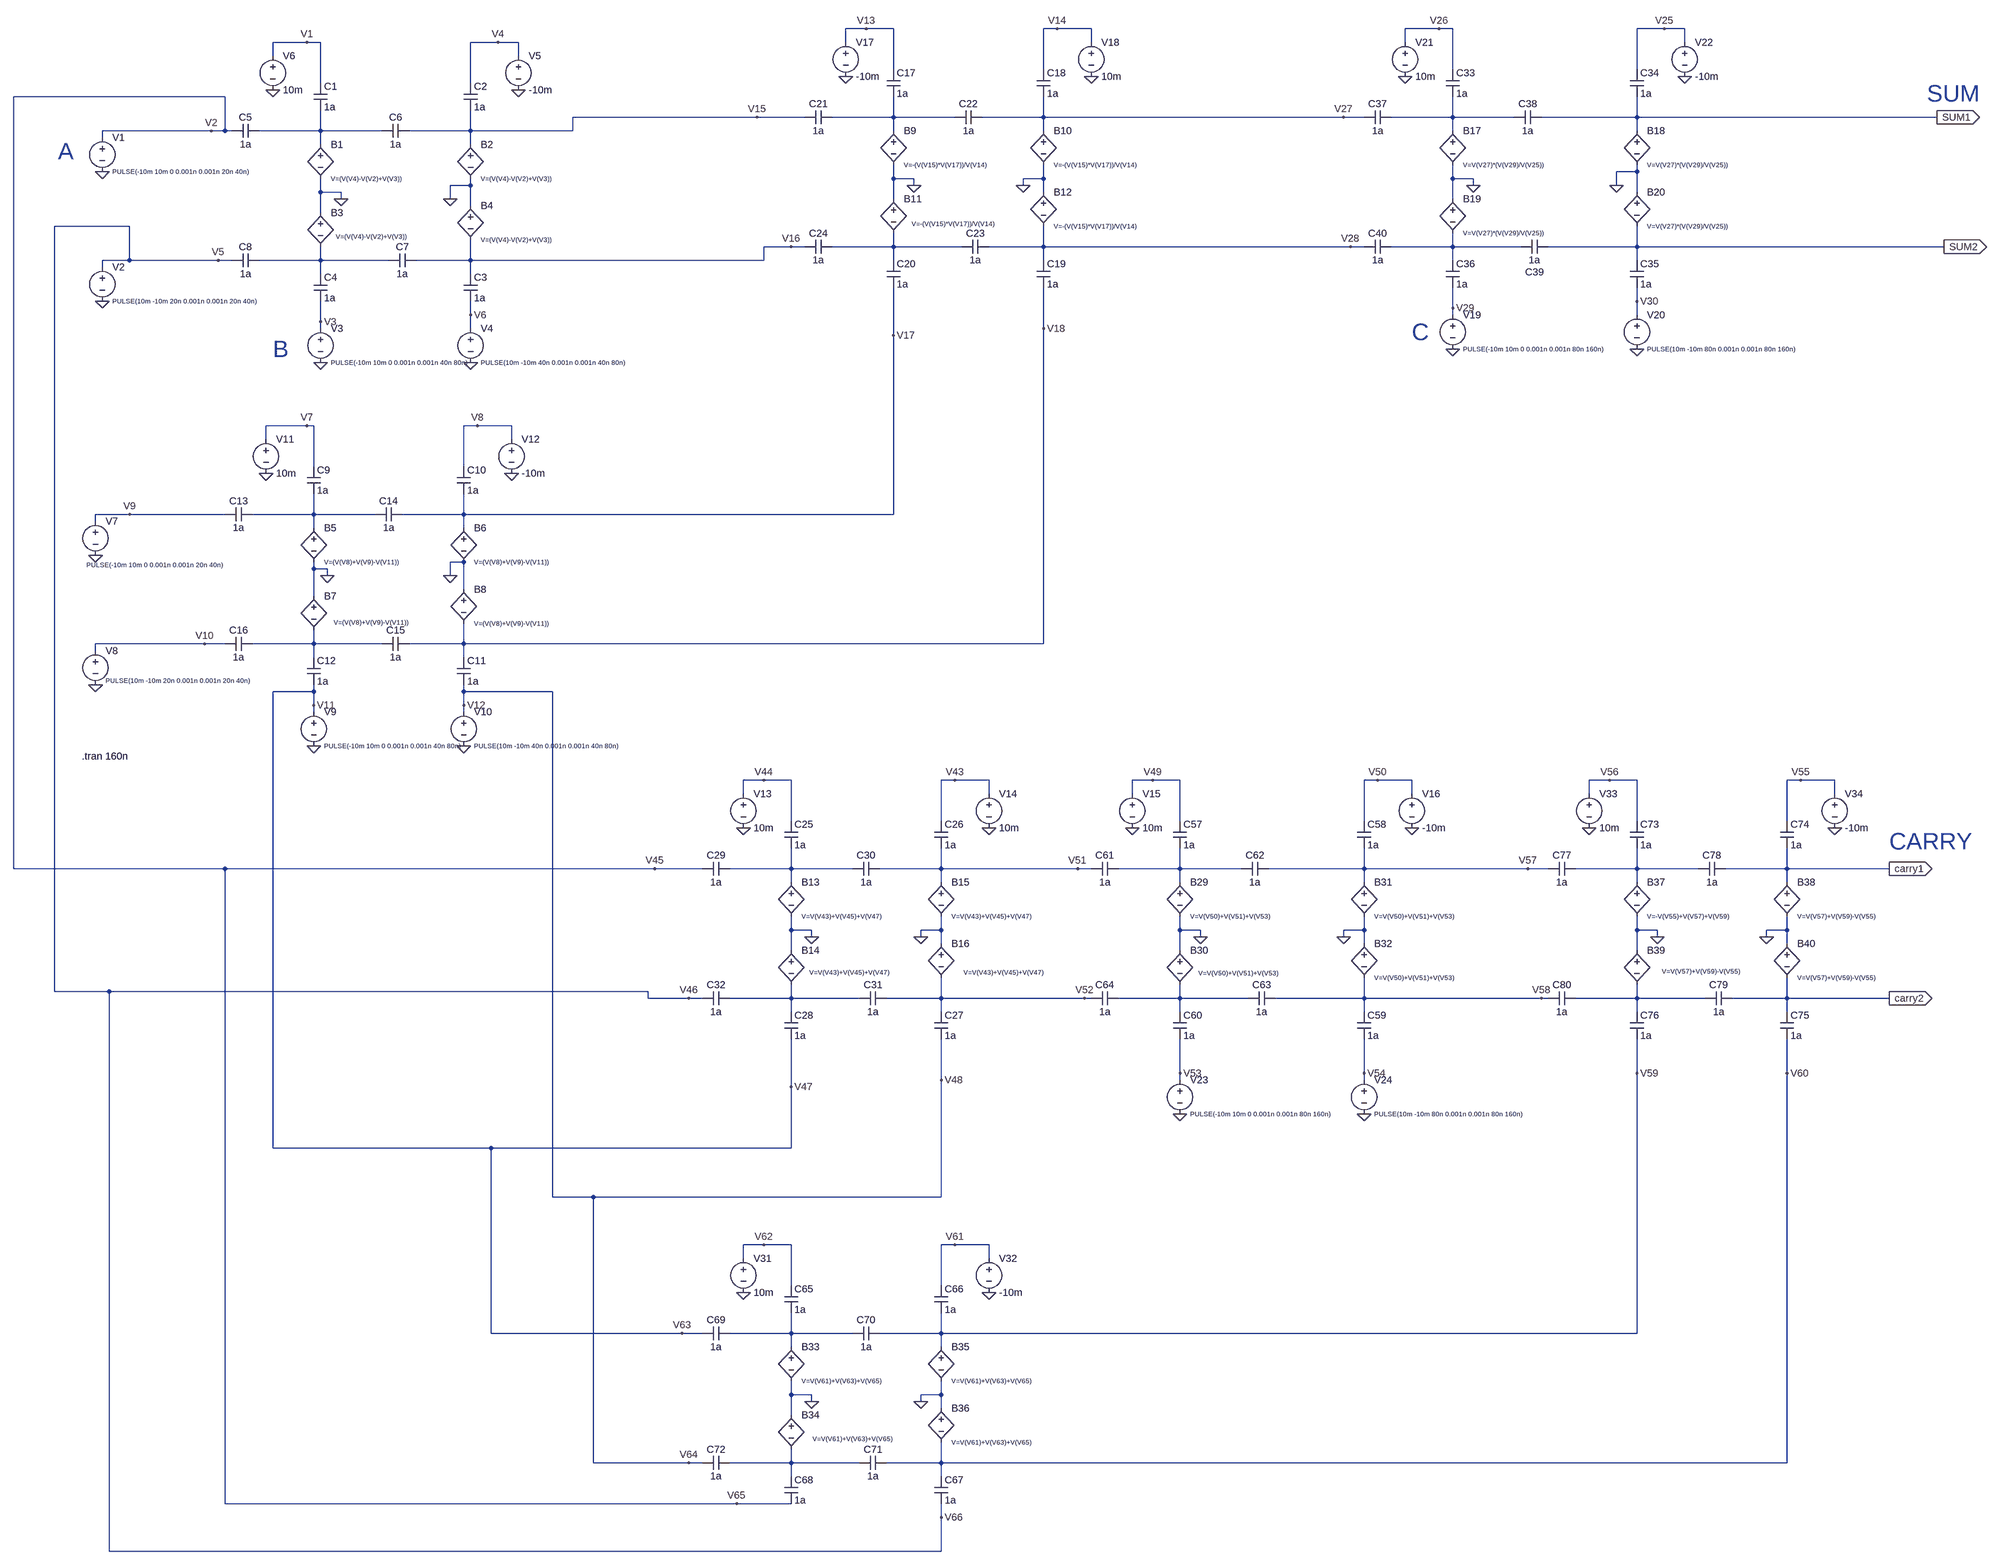
[diagram p0: schematic full_adder.asc]
full_adder.asc, the LTspice schematic file:
Version 4.1
SHEET 1 4352 3636
WIRE 912 -400 864 -400
WIRE 976 -400 912 -400
WIRE 1360 -400 1328 -400
WIRE 1440 -400 1360 -400
WIRE 2256 -400 2176 -400
WIRE 2288 -400 2256 -400
WIRE 2784 -400 2720 -400
WIRE 2832 -400 2784 -400
WIRE -400 -368 -480 -368
WIRE -368 -368 -400 -368
WIRE 48 -368 -16 -368
WIRE 96 -368 48 -368
WIRE 864 -368 864 -400
WIRE 1440 -368 1440 -400
WIRE 2176 -368 2176 -400
WIRE 2832 -368 2832 -400
WIRE -480 -336 -480 -368
WIRE 96 -336 96 -368
WIRE 976 -304 976 -400
WIRE 1328 -304 1328 -400
WIRE 2288 -304 2288 -400
WIRE 2720 -304 2720 -400
WIRE -368 -272 -368 -368
WIRE -16 -272 -16 -368
WIRE -592 -240 -1088 -240
WIRE 656 -192 224 -192
WIRE 768 -192 656 -192
WIRE 976 -192 976 -240
WIRE 976 -192 832 -192
WIRE 1120 -192 976 -192
WIRE 1328 -192 1328 -240
WIRE 1328 -192 1184 -192
WIRE 2032 -192 1328 -192
WIRE 2080 -192 2032 -192
WIRE 2288 -192 2288 -240
WIRE 2288 -192 2144 -192
WIRE 2432 -192 2288 -192
WIRE 2720 -192 2720 -240
WIRE 2720 -192 2496 -192
WIRE 3424 -192 2720 -192
WIRE -624 -160 -880 -160
WIRE -592 -160 -592 -240
WIRE -592 -160 -624 -160
WIRE -576 -160 -592 -160
WIRE -368 -160 -368 -208
WIRE -368 -160 -512 -160
WIRE -224 -160 -368 -160
WIRE -16 -160 -16 -208
WIRE -16 -160 -160 -160
WIRE 224 -160 224 -192
WIRE 224 -160 -16 -160
WIRE 976 -160 976 -192
WIRE 1328 -160 1328 -192
WIRE 2288 -160 2288 -192
WIRE 2720 -160 2720 -192
WIRE -880 -144 -880 -160
WIRE -368 -128 -368 -160
WIRE -16 -128 -16 -160
WIRE 2720 -64 2720 -80
WIRE 2720 -64 2672 -64
WIRE 976 -48 976 -80
WIRE 1024 -48 976 -48
WIRE 1328 -48 1328 -80
WIRE 1328 -48 1280 -48
WIRE 2288 -48 2288 -80
WIRE 2336 -48 2288 -48
WIRE -16 -32 -16 -48
WIRE -16 -32 -64 -32
WIRE 1024 -32 1024 -48
WIRE 1280 -32 1280 -48
WIRE 2336 -32 2336 -48
WIRE 2672 -32 2672 -64
WIRE -368 -16 -368 -48
WIRE -320 -16 -368 -16
WIRE 1328 -16 1328 -48
WIRE 2720 -16 2720 -64
WIRE -320 0 -320 -16
WIRE -64 0 -64 -32
WIRE 976 0 976 -48
WIRE 2288 0 2288 -48
WIRE -16 16 -16 -32
WIRE -368 32 -368 -16
WIRE -816 64 -992 64
WIRE 736 112 672 112
WIRE 768 112 736 112
WIRE 976 112 976 80
WIRE 976 112 832 112
WIRE 1136 112 976 112
WIRE 1328 112 1328 64
WIRE 1328 112 1200 112
WIRE 2048 112 1328 112
WIRE 2080 112 2048 112
WIRE 2288 112 2288 80
WIRE 2288 112 2144 112
WIRE 2448 112 2288 112
WIRE 2720 112 2720 64
WIRE 2720 112 2512 112
WIRE 3440 112 2720 112
WIRE -816 144 -816 64
WIRE -816 144 -880 144
WIRE -608 144 -816 144
WIRE -576 144 -608 144
WIRE -368 144 -368 112
WIRE -368 144 -512 144
WIRE -208 144 -368 144
WIRE -16 144 -16 96
WIRE -16 144 -144 144
WIRE 672 144 672 112
WIRE 672 144 -16 144
WIRE 976 144 976 112
WIRE 1328 144 1328 112
WIRE 2288 144 2288 112
WIRE 2720 144 2720 112
WIRE -880 160 -880 144
WIRE -368 176 -368 144
WIRE -16 176 -16 144
WIRE 2720 240 2720 208
WIRE 2288 256 2288 208
WIRE -16 272 -16 240
WIRE 2288 272 2288 256
WIRE 2720 272 2720 240
WIRE -368 288 -368 240
WIRE -368 304 -368 288
WIRE -16 304 -16 272
WIRE 1328 304 1328 208
WIRE 976 320 976 208
WIRE -400 544 -496 544
WIRE -384 544 -400 544
WIRE 0 544 -32 544
WIRE 80 544 0 544
WIRE -496 576 -496 544
WIRE 80 576 80 544
WIRE -384 640 -384 544
WIRE -32 640 -32 544
WIRE -816 752 -896 752
WIRE -592 752 -816 752
WIRE -384 752 -384 704
WIRE -384 752 -528 752
WIRE -240 752 -384 752
WIRE -32 752 -32 704
WIRE -32 752 -176 752
WIRE 976 752 976 320
WIRE 976 752 -32 752
WIRE -896 768 -896 752
WIRE -384 784 -384 752
WIRE -32 784 -32 752
WIRE -32 864 -64 864
WIRE -384 880 -384 864
WIRE -352 880 -384 880
WIRE -352 896 -352 880
WIRE -64 896 -64 864
WIRE -32 928 -32 864
WIRE -384 944 -384 880
WIRE -640 1056 -896 1056
WIRE -592 1056 -640 1056
WIRE -384 1056 -384 1024
WIRE -384 1056 -528 1056
WIRE -224 1056 -384 1056
WIRE -32 1056 -32 1008
WIRE -32 1056 -160 1056
WIRE 1328 1056 1328 304
WIRE 1328 1056 -32 1056
WIRE -896 1072 -896 1056
WIRE -384 1088 -384 1056
WIRE -32 1088 -32 1056
WIRE -384 1168 -384 1152
WIRE -384 1168 -480 1168
WIRE -32 1168 -32 1152
WIRE 176 1168 -32 1168
WIRE -384 1200 -384 1168
WIRE -32 1200 -32 1168
WIRE -384 1216 -384 1200
WIRE -32 1216 -32 1200
WIRE 672 1376 624 1376
WIRE 736 1376 672 1376
WIRE 1120 1376 1088 1376
WIRE 1200 1376 1120 1376
WIRE 1584 1376 1536 1376
WIRE 1648 1376 1584 1376
WIRE 2112 1376 2080 1376
WIRE 2192 1376 2112 1376
WIRE 2656 1376 2608 1376
WIRE 2720 1376 2656 1376
WIRE 3104 1376 3072 1376
WIRE 3184 1376 3104 1376
WIRE 624 1408 624 1376
WIRE 1200 1408 1200 1376
WIRE 1536 1408 1536 1376
WIRE 2192 1408 2192 1376
WIRE 2608 1408 2608 1376
WIRE 3184 1408 3184 1376
WIRE 736 1472 736 1376
WIRE 1088 1472 1088 1376
WIRE 1648 1472 1648 1376
WIRE 2080 1472 2080 1376
WIRE 2720 1472 2720 1376
WIRE 3072 1472 3072 1376
WIRE -1088 1584 -1088 -240
WIRE -592 1584 -1088 1584
WIRE 416 1584 -592 1584
WIRE 528 1584 416 1584
WIRE 736 1584 736 1536
WIRE 736 1584 592 1584
WIRE 880 1584 736 1584
WIRE 1088 1584 1088 1536
WIRE 1088 1584 944 1584
WIRE 1408 1584 1088 1584
WIRE 1440 1584 1408 1584
WIRE 1648 1584 1648 1536
WIRE 1648 1584 1504 1584
WIRE 1792 1584 1648 1584
WIRE 2080 1584 2080 1536
WIRE 2080 1584 1856 1584
WIRE 2464 1584 2080 1584
WIRE 2512 1584 2464 1584
WIRE 2720 1584 2720 1536
WIRE 2720 1584 2576 1584
WIRE 2864 1584 2720 1584
WIRE 3072 1584 3072 1536
WIRE 3072 1584 2928 1584
WIRE 3312 1584 3072 1584
WIRE 736 1616 736 1584
WIRE 1088 1616 1088 1584
WIRE 1648 1616 1648 1584
WIRE 2080 1616 2080 1584
WIRE 2720 1616 2720 1584
WIRE 3072 1616 3072 1584
WIRE 736 1728 736 1696
WIRE 784 1728 736 1728
WIRE 1088 1728 1088 1696
WIRE 1088 1728 1040 1728
WIRE 1648 1728 1648 1696
WIRE 1696 1728 1648 1728
WIRE 2080 1728 2080 1696
WIRE 2080 1728 2032 1728
WIRE 2720 1728 2720 1696
WIRE 2768 1728 2720 1728
WIRE 3072 1728 3072 1696
WIRE 3072 1728 3024 1728
WIRE 784 1744 784 1728
WIRE 1040 1744 1040 1728
WIRE 1696 1744 1696 1728
WIRE 2032 1744 2032 1728
WIRE 2768 1744 2768 1728
WIRE 3024 1744 3024 1728
WIRE 1088 1760 1088 1728
WIRE 2080 1760 2080 1728
WIRE 3072 1760 3072 1728
WIRE 736 1776 736 1728
WIRE 1648 1776 1648 1728
WIRE 2720 1776 2720 1728
WIRE -992 1872 -992 64
WIRE -864 1872 -992 1872
WIRE 400 1872 -864 1872
WIRE 400 1888 400 1872
WIRE 496 1888 400 1888
WIRE 528 1888 496 1888
WIRE 736 1888 736 1856
WIRE 736 1888 592 1888
WIRE 896 1888 736 1888
WIRE 1088 1888 1088 1840
WIRE 1088 1888 960 1888
WIRE 1424 1888 1088 1888
WIRE 1440 1888 1424 1888
WIRE 1648 1888 1648 1856
WIRE 1648 1888 1504 1888
WIRE 1808 1888 1648 1888
WIRE 2080 1888 2080 1840
WIRE 2080 1888 1872 1888
WIRE 2496 1888 2080 1888
WIRE 2512 1888 2496 1888
WIRE 2720 1888 2720 1856
WIRE 2720 1888 2576 1888
WIRE 2880 1888 2720 1888
WIRE 3072 1888 3072 1840
WIRE 3072 1888 2944 1888
WIRE 3312 1888 3072 1888
WIRE 736 1920 736 1888
WIRE 1088 1920 1088 1888
WIRE 1648 1920 1648 1888
WIRE 2080 1920 2080 1888
WIRE 2720 1920 2720 1888
WIRE 3072 1920 3072 1888
WIRE 1648 2064 1648 1984
WIRE 2080 2064 2080 1984
WIRE 2720 2064 2720 1984
WIRE 3072 2064 3072 1984
WIRE 1088 2080 1088 1984
WIRE 1648 2080 1648 2064
WIRE 2080 2080 2080 2064
WIRE 736 2096 736 1984
WIRE -480 2240 -480 1168
WIRE 32 2240 -480 2240
WIRE 736 2240 736 2096
WIRE 736 2240 32 2240
WIRE 176 2448 176 1168
WIRE 272 2448 176 2448
WIRE 1088 2448 1088 2080
WIRE 1088 2448 272 2448
WIRE 672 2560 624 2560
WIRE 736 2560 672 2560
WIRE 1120 2560 1088 2560
WIRE 1200 2560 1120 2560
WIRE 624 2592 624 2560
WIRE 1200 2592 1200 2560
WIRE 736 2656 736 2560
WIRE 1088 2656 1088 2560
WIRE 32 2768 32 2240
WIRE 480 2768 32 2768
WIRE 528 2768 480 2768
WIRE 736 2768 736 2720
WIRE 736 2768 592 2768
WIRE 880 2768 736 2768
WIRE 1088 2768 1088 2720
WIRE 1088 2768 944 2768
WIRE 2720 2768 2720 2064
WIRE 2720 2768 1088 2768
WIRE 736 2800 736 2768
WIRE 1088 2800 1088 2768
WIRE 736 2912 736 2880
WIRE 784 2912 736 2912
WIRE 1088 2912 1088 2880
WIRE 1088 2912 1040 2912
WIRE 784 2928 784 2912
WIRE 1040 2928 1040 2912
WIRE 1088 2944 1088 2912
WIRE 736 2960 736 2912
WIRE 272 3072 272 2448
WIRE 496 3072 272 3072
WIRE 528 3072 496 3072
WIRE 736 3072 736 3040
WIRE 736 3072 592 3072
WIRE 896 3072 736 3072
WIRE 1088 3072 1088 3024
WIRE 1088 3072 960 3072
WIRE 3072 3072 3072 2064
WIRE 3072 3072 1088 3072
WIRE 736 3104 736 3072
WIRE 1088 3104 1088 3072
WIRE -592 3168 -592 1584
WIRE 608 3168 -592 3168
WIRE 736 3168 608 3168
WIRE 1088 3200 1088 3168
WIRE -864 3280 -864 1872
WIRE 1088 3280 1088 3200
WIRE 1088 3280 -864 3280
FLAG -480 -256 0
FLAG -880 -64 0
FLAG -880 240 0
FLAG -368 384 0
FLAG -16 384 0
FLAG 96 -256 0
FLAG -400 -368 V1
FLAG -624 -160 V2
FLAG -608 144 V5
FLAG -368 288 V3
FLAG -16 272 V6
FLAG 48 -368 V4
FLAG -496 656 0
FLAG -896 848 0
FLAG -896 1152 0
FLAG -384 1296 0
FLAG -32 1296 0
FLAG 80 656 0
FLAG 864 -288 0
FLAG 1440 -288 0
FLAG -400 544 V7
FLAG 0 544 V8
FLAG -816 752 V9
FLAG -640 1056 V10
FLAG -384 1200 V11
FLAG -32 1200 V12
FLAG 912 -400 V13
FLAG 1360 -400 V14
FLAG 656 -192 V15
FLAG 736 112 V16
FLAG 976 320 V17
FLAG 1328 304 V18
FLAG -320 0 0
FLAG -64 0 0
FLAG 1024 -32 0
FLAG 1280 -32 0
FLAG -352 896 0
FLAG -64 896 0
FLAG 624 1488 0
FLAG 1200 1488 0
FLAG 672 1376 V44
FLAG 1120 1376 V43
FLAG 416 1584 V45
FLAG 496 1888 V46
FLAG 736 2096 V47
FLAG 1088 2080 V48
FLAG 784 1744 0
FLAG 1040 1744 0
FLAG 2176 -288 0
FLAG 2288 352 0
FLAG 2720 352 0
FLAG 2832 -288 0
FLAG 2256 -400 V26
FLAG 2032 -192 V27
FLAG 2048 112 V28
FLAG 2288 256 V29
FLAG 2720 240 V30
FLAG 2784 -400 V25
FLAG 2336 -32 0
FLAG 2672 -32 0
FLAG 1536 1488 0
FLAG 2192 1488 0
FLAG 1584 1376 V49
FLAG 2112 1376 V50
FLAG 1696 1744 0
FLAG 2032 1744 0
FLAG 1648 2160 0
FLAG 2080 2160 0
FLAG 1648 2064 V53
FLAG 2080 2064 V54
FLAG 624 2672 0
FLAG 1200 2672 0
FLAG 672 2560 V62
FLAG 1120 2560 V61
FLAG 496 3072 V64
FLAG 784 2928 0
FLAG 1040 2928 0
FLAG 2608 1488 0
FLAG 3184 1488 0
FLAG 3312 1584 carry1
IOPIN 3312 1584 Out
FLAG 3312 1888 carry2
IOPIN 3312 1888 Out
FLAG 2656 1376 V56
FLAG 3104 1376 V55
FLAG 2768 1744 0
FLAG 3024 1744 0
FLAG 2720 2064 V59
FLAG 3072 2064 V60
FLAG 1408 1584 V51
FLAG 1424 1888 V52
FLAG 2464 1584 V57
FLAG 2496 1888 V58
FLAG 480 2768 V63
FLAG 608 3168 V65
FLAG 1088 3200 V66
FLAG 3424 -192 SUM1
IOPIN 3424 -192 Out
FLAG 3440 112 SUM2
IOPIN 3440 112 Out
SYMBOL bv -368 -144 R0
WINDOW 3 24 96 Left 1
SYMATTR Value V=(V(V4)-V(V2)+V(V3))
SYMATTR InstName B1
SYMBOL bv -16 -144 R0
WINDOW 3 24 96 Left 1
SYMATTR Value V=(V(V4)-V(V2)+V(V3))
SYMATTR InstName B2
SYMBOL bv -368 16 R0
WINDOW 3 36 72 Left 1
SYMATTR Value V=(V(V4)-V(V2)+V(V3))
SYMATTR InstName B3
SYMBOL bv -16 0 R0
WINDOW 3 24 96 Left 1
SYMATTR Value V=(V(V4)-V(V2)+V(V3))
SYMATTR InstName B4
SYMBOL cap -384 -272 R0
SYMATTR InstName C1
SYMATTR Value 1a
SYMBOL cap -32 -272 R0
SYMATTR InstName C2
SYMATTR Value 1a
SYMBOL cap -32 176 R0
SYMATTR InstName C3
SYMATTR Value 1a
SYMBOL cap -384 176 R0
SYMATTR InstName C4
SYMATTR Value 1a
SYMBOL cap -512 -176 R90
WINDOW 0 0 32 VBottom 2
WINDOW 3 32 32 VTop 2
SYMATTR InstName C5
SYMATTR Value 1a
SYMBOL cap -160 -176 R90
WINDOW 0 0 32 VBottom 2
WINDOW 3 32 32 VTop 2
SYMATTR InstName C6
SYMATTR Value 1a
SYMBOL cap -144 128 R90
WINDOW 0 0 32 VBottom 2
WINDOW 3 32 32 VTop 2
SYMATTR InstName C7
SYMATTR Value 1a
SYMBOL cap -512 128 R90
WINDOW 0 0 32 VBottom 2
WINDOW 3 32 32 VTop 2
SYMATTR InstName C8
SYMATTR Value 1a
SYMBOL voltage -880 -160 R0
WINDOW 3 24 96 Left 1
WINDOW 123 0 0 Left 0
WINDOW 39 0 0 Left 0
SYMATTR Value PULSE(-10m 10m 0 0.001n 0.001n 20n 40n)
SYMATTR InstName V1
SYMBOL voltage -880 144 R0
WINDOW 3 24 96 Left 1
WINDOW 123 0 0 Left 0
WINDOW 39 0 0 Left 0
SYMATTR Value PULSE(10m -10m 20n 0.001n 0.001n 20n 40n)
SYMATTR InstName V2
SYMBOL voltage -368 288 R0
WINDOW 3 24 96 Left 1
WINDOW 123 0 0 Left 0
WINDOW 39 0 0 Left 0
SYMATTR Value PULSE(-10m 10m 0 0.001n 0.001n 40n 80n)
SYMATTR InstName V3
SYMBOL voltage -16 288 R0
WINDOW 3 24 96 Left 1
WINDOW 123 0 0 Left 0
WINDOW 39 0 0 Left 0
SYMATTR Value PULSE(10m -10m 40n 0.001n 0.001n 40n 80n)
SYMATTR InstName V4
SYMBOL voltage -480 -352 R0
WINDOW 123 0 0 Left 0
WINDOW 39 0 0 Left 0
SYMATTR InstName V6
SYMATTR Value 10m
SYMBOL voltage 96 -352 R0
WINDOW 123 0 0 Left 0
WINDOW 39 0 0 Left 0
SYMATTR InstName V5
SYMATTR Value -10m
SYMBOL bv -384 768 R0
WINDOW 3 24 96 Left 1
SYMATTR Value V=(V(V8)+V(V9)-V(V11))
SYMATTR InstName B5
SYMBOL bv -32 768 R0
WINDOW 3 24 96 Left 1
SYMATTR Value V=(V(V8)+V(V9)-V(V11))
SYMATTR InstName B6
SYMBOL bv -384 928 R0
WINDOW 3 47 78 Left 1
SYMATTR Value V=(V(V8)+V(V9)-V(V11))
SYMATTR InstName B7
SYMBOL bv -32 912 R0
WINDOW 3 24 96 Left 1
SYMATTR Value V=(V(V8)+V(V9)-V(V11))
SYMATTR InstName B8
SYMBOL cap -400 640 R0
SYMATTR InstName C9
SYMATTR Value 1a
SYMBOL cap -48 640 R0
SYMATTR InstName C10
SYMATTR Value 1a
SYMBOL cap -48 1088 R0
SYMATTR InstName C11
SYMATTR Value 1a
SYMBOL cap -400 1088 R0
SYMATTR InstName C12
SYMATTR Value 1a
SYMBOL cap -528 736 R90
WINDOW 0 0 32 VBottom 2
WINDOW 3 32 32 VTop 2
SYMATTR InstName C13
SYMATTR Value 1a
SYMBOL cap -176 736 R90
WINDOW 0 0 32 VBottom 2
WINDOW 3 32 32 VTop 2
SYMATTR InstName C14
SYMATTR Value 1a
SYMBOL cap -160 1040 R90
WINDOW 0 0 32 VBottom 2
WINDOW 3 32 32 VTop 2
SYMATTR InstName C15
SYMATTR Value 1a
SYMBOL cap -528 1040 R90
WINDOW 0 0 32 VBottom 2
WINDOW 3 32 32 VTop 2
SYMATTR InstName C16
SYMATTR Value 1a
SYMBOL voltage -896 752 R0
WINDOW 3 -21 119 Left 1
WINDOW 123 0 0 Left 0
WINDOW 39 0 0 Left 0
SYMATTR Value PULSE(-10m 10m 0 0.001n 0.001n 20n 40n)
SYMATTR InstName V7
SYMBOL voltage -896 1056 R0
WINDOW 3 24 86 Left 1
WINDOW 123 0 0 Left 0
WINDOW 39 0 0 Left 0
SYMATTR Value PULSE(10m -10m 20n 0.001n 0.001n 20n 40n)
SYMATTR InstName V8
SYMBOL voltage -384 1200 R0
WINDOW 3 24 96 Left 1
WINDOW 123 0 0 Left 0
WINDOW 39 0 0 Left 0
SYMATTR Value PULSE(-10m 10m 0 0.001n 0.001n 40n 80n)
SYMATTR InstName V9
SYMBOL voltage -32 1200 R0
WINDOW 3 24 96 Left 1
WINDOW 123 0 0 Left 0
WINDOW 39 0 0 Left 0
SYMATTR Value PULSE(10m -10m 40n 0.001n 0.001n 40n 80n)
SYMATTR InstName V10
SYMBOL voltage -496 560 R0
WINDOW 123 0 0 Left 0
WINDOW 39 0 0 Left 0
SYMATTR InstName V11
SYMATTR Value 10m
SYMBOL voltage 80 560 R0
WINDOW 123 0 0 Left 0
WINDOW 39 0 0 Left 0
SYMATTR InstName V12
SYMATTR Value -10m
SYMBOL bv 976 -176 R0
WINDOW 3 24 96 Left 1
SYMATTR Value V=-(V(V15)*V(V17))/V(V14)
SYMATTR InstName B9
SYMBOL bv 1328 -176 R0
WINDOW 3 24 96 Left 1
SYMATTR Value V=-(V(V15)*V(V17))/V(V14)
SYMATTR InstName B10
SYMBOL bv 976 -16 R0
WINDOW 3 43 74 Left 1
SYMATTR Value V=-(V(V15)*V(V17))/V(V14)
SYMATTR InstName B11
SYMBOL bv 1328 -32 R0
WINDOW 3 24 96 Left 1
SYMATTR Value V=-(V(V15)*V(V17))/V(V14)
SYMATTR InstName B12
SYMBOL cap 960 -304 R0
SYMATTR InstName C17
SYMATTR Value 1a
SYMBOL cap 1312 -304 R0
SYMATTR InstName C18
SYMATTR Value 1a
SYMBOL cap 1312 144 R0
SYMATTR InstName C19
SYMATTR Value 1a
SYMBOL cap 960 144 R0
SYMATTR InstName C20
SYMATTR Value 1a
SYMBOL cap 832 -208 R90
WINDOW 0 0 32 VBottom 2
WINDOW 3 32 32 VTop 2
SYMATTR InstName C21
SYMATTR Value 1a
SYMBOL cap 1184 -208 R90
WINDOW 0 0 32 VBottom 2
WINDOW 3 32 32 VTop 2
SYMATTR InstName C22
SYMATTR Value 1a
SYMBOL cap 1200 96 R90
WINDOW 0 0 32 VBottom 2
WINDOW 3 32 32 VTop 2
SYMATTR InstName C23
SYMATTR Value 1a
SYMBOL cap 832 96 R90
WINDOW 0 0 32 VBottom 2
WINDOW 3 32 32 VTop 2
SYMATTR InstName C24
SYMATTR Value 1a
SYMBOL voltage 864 -384 R0
WINDOW 123 0 0 Left 0
WINDOW 39 0 0 Left 0
SYMATTR InstName V17
SYMATTR Value -10m
SYMBOL voltage 1440 -384 R0
WINDOW 123 0 0 Left 0
WINDOW 39 0 0 Left 0
SYMATTR InstName V18
SYMATTR Value 10m
SYMBOL bv 736 1600 R0
WINDOW 3 24 96 Left 1
SYMATTR Value V=V(V43)+V(V45)+V(V47)
SYMATTR InstName B13
SYMBOL cap 720 1472 R0
SYMATTR InstName C25
SYMATTR Value 1a
SYMBOL cap 1072 1472 R0
SYMATTR InstName C26
SYMATTR Value 1a
SYMBOL cap 1072 1920 R0
SYMATTR InstName C27
SYMATTR Value 1a
SYMBOL cap 720 1920 R0
SYMATTR InstName C28
SYMATTR Value 1a
SYMBOL cap 592 1568 R90
WINDOW 0 0 32 VBottom 2
WINDOW 3 32 32 VTop 2
SYMATTR InstName C29
SYMATTR Value 1a
SYMBOL cap 944 1568 R90
WINDOW 0 0 32 VBottom 2
WINDOW 3 32 32 VTop 2
SYMATTR InstName C30
SYMATTR Value 1a
SYMBOL cap 960 1872 R90
WINDOW 0 0 32 VBottom 2
WINDOW 3 32 32 VTop 2
SYMATTR InstName C31
SYMATTR Value 1a
SYMBOL cap 592 1872 R90
WINDOW 0 0 32 VBottom 2
WINDOW 3 32 32 VTop 2
SYMATTR InstName C32
SYMATTR Value 1a
SYMBOL voltage 624 1392 R0
WINDOW 123 0 0 Left 0
WINDOW 39 0 0 Left 0
SYMATTR InstName V13
SYMATTR Value 10m
SYMBOL voltage 1200 1392 R0
WINDOW 123 0 0 Left 0
WINDOW 39 0 0 Left 0
SYMATTR InstName V14
SYMATTR Value 10m
SYMBOL bv 2288 -176 R0
WINDOW 3 24 96 Left 1
SYMATTR Value V=V(V27)*(V(V29)/V(V25))
SYMATTR InstName B17
SYMBOL bv 2720 -176 R0
WINDOW 3 24 96 Left 1
SYMATTR Value V=V(V27)*(V(V29)/V(V25))
SYMATTR InstName B18
SYMBOL bv 2288 -16 R0
WINDOW 3 24 96 Left 1
SYMATTR Value V=V(V27)*(V(V29)/V(V25))
SYMATTR InstName B19
SYMBOL bv 2720 -32 R0
WINDOW 3 24 96 Left 1
SYMATTR Value V=V(V27)*(V(V29)/V(V25))
SYMATTR InstName B20
SYMBOL cap 2272 -304 R0
SYMATTR InstName C33
SYMATTR Value 1a
SYMBOL cap 2704 -304 R0
SYMATTR InstName C34
SYMATTR Value 1a
SYMBOL cap 2704 144 R0
SYMATTR InstName C35
SYMATTR Value 1a
SYMBOL cap 2272 144 R0
SYMATTR InstName C36
SYMATTR Value 1a
SYMBOL cap 2144 -208 R90
WINDOW 0 0 32 VBottom 2
WINDOW 3 32 32 VTop 2
SYMATTR InstName C37
SYMATTR Value 1a
SYMBOL cap 2496 -208 R90
WINDOW 0 0 32 VBottom 2
WINDOW 3 32 32 VTop 2
SYMATTR InstName C38
SYMATTR Value 1a
SYMBOL cap 2512 96 R90
WINDOW 0 91 32 VBottom 2
WINDOW 3 32 32 VTop 2
SYMATTR InstName C39
SYMATTR Value 1a
SYMBOL cap 2144 96 R90
WINDOW 0 0 32 VBottom 2
WINDOW 3 32 32 VTop 2
SYMATTR InstName C40
SYMATTR Value 1a
SYMBOL voltage 2288 256 R0
WINDOW 3 24 96 Left 1
WINDOW 123 0 0 Left 0
WINDOW 39 0 0 Left 0
SYMATTR Value PULSE(-10m 10m 0 0.001n 0.001n 80n 160n)
SYMATTR InstName V19
SYMBOL voltage 2720 256 R0
WINDOW 3 24 96 Left 1
WINDOW 123 0 0 Left 0
WINDOW 39 0 0 Left 0
SYMATTR Value PULSE(10m -10m 80n 0.001n 0.001n 80n 160n)
SYMATTR InstName V20
SYMBOL voltage 2176 -384 R0
WINDOW 123 0 0 Left 0
WINDOW 39 0 0 Left 0
SYMATTR InstName V21
SYMATTR Value 10m
SYMBOL voltage 2832 -384 R0
WINDOW 123 0 0 Left 0
WINDOW 39 0 0 Left 0
SYMATTR InstName V22
SYMATTR Value -10m
SYMBOL bv 1648 1600 R0
WINDOW 3 24 96 Left 1
SYMATTR Value V=V(V50)+V(V51)+V(V53)
SYMATTR InstName B29
SYMBOL cap 1632 1472 R0
SYMATTR InstName C57
SYMATTR Value 1a
SYMBOL cap 2064 1472 R0
SYMATTR InstName C58
SYMATTR Value 1a
SYMBOL cap 2064 1920 R0
SYMATTR InstName C59
SYMATTR Value 1a
SYMBOL cap 1632 1920 R0
SYMATTR InstName C60
SYMATTR Value 1a
SYMBOL cap 1504 1568 R90
WINDOW 0 0 32 VBottom 2
WINDOW 3 32 32 VTop 2
SYMATTR InstName C61
SYMATTR Value 1a
SYMBOL cap 1856 1568 R90
WINDOW 0 0 32 VBottom 2
WINDOW 3 32 32 VTop 2
SYMATTR InstName C62
SYMATTR Value 1a
SYMBOL cap 1872 1872 R90
WINDOW 0 0 32 VBottom 2
WINDOW 3 32 32 VTop 2
SYMATTR InstName C63
SYMATTR Value 1a
SYMBOL cap 1504 1872 R90
WINDOW 0 0 32 VBottom 2
WINDOW 3 32 32 VTop 2
SYMATTR InstName C64
SYMATTR Value 1a
SYMBOL voltage 1536 1392 R0
WINDOW 123 0 0 Left 0
WINDOW 39 0 0 Left 0
SYMATTR InstName V15
SYMATTR Value 10m
SYMBOL voltage 2192 1392 R0
WINDOW 123 0 0 Left 0
WINDOW 39 0 0 Left 0
SYMATTR InstName V16
SYMATTR Value -10m
SYMBOL voltage 1648 2064 R0
WINDOW 3 24 96 Left 1
WINDOW 123 0 0 Left 0
WINDOW 39 0 0 Left 0
SYMATTR Value PULSE(-10m 10m 0 0.001n 0.001n 80n 160n)
SYMATTR InstName V23
SYMBOL voltage 2080 2064 R0
WINDOW 3 24 96 Left 1
WINDOW 123 0 0 Left 0
WINDOW 39 0 0 Left 0
SYMATTR Value PULSE(10m -10m 80n 0.001n 0.001n 80n 160n)
SYMATTR InstName V24
SYMBOL bv 736 2784 R0
WINDOW 3 24 96 Left 1
SYMATTR Value V=V(V61)+V(V63)+V(V65)
SYMATTR InstName B33
SYMBOL cap 720 2656 R0
SYMATTR InstName C65
SYMATTR Value 1a
SYMBOL cap 1072 2656 R0
SYMATTR InstName C66
SYMATTR Value 1a
SYMBOL cap 1072 3104 R0
SYMATTR InstName C67
SYMATTR Value 1a
SYMBOL cap 720 3104 R0
SYMATTR InstName C68
SYMATTR Value 1a
SYMBOL cap 592 2752 R90
WINDOW 0 0 32 VBottom 2
WINDOW 3 32 32 VTop 2
SYMATTR InstName C69
SYMATTR Value 1a
SYMBOL cap 944 2752 R90
WINDOW 0 0 32 VBottom 2
WINDOW 3 32 32 VTop 2
SYMATTR InstName C70
SYMATTR Value 1a
SYMBOL cap 960 3056 R90
WINDOW 0 0 32 VBottom 2
WINDOW 3 32 32 VTop 2
SYMATTR InstName C71
SYMATTR Value 1a
SYMBOL cap 592 3056 R90
WINDOW 0 0 32 VBottom 2
WINDOW 3 32 32 VTop 2
SYMATTR InstName C72
SYMATTR Value 1a
SYMBOL voltage 624 2576 R0
WINDOW 123 0 0 Left 0
WINDOW 39 0 0 Left 0
SYMATTR InstName V31
SYMATTR Value 10m
SYMBOL voltage 1200 2576 R0
WINDOW 123 0 0 Left 0
WINDOW 39 0 0 Left 0
SYMATTR InstName V32
SYMATTR Value -10m
SYMBOL bv 2720 1600 R0
WINDOW 3 24 96 Left 1
SYMATTR Value V=-V(V55)+V(V57)+V(V59)
SYMATTR InstName B37
SYMBOL cap 2704 1472 R0
SYMATTR InstName C73
SYMATTR Value 1a
SYMBOL cap 3056 1472 R0
SYMATTR InstName C74
SYMATTR Value 1a
SYMBOL cap 3056 1920 R0
SYMATTR InstName C75
SYMATTR Value 1a
SYMBOL cap 2704 1920 R0
SYMATTR InstName C76
SYMATTR Value 1a
SYMBOL cap 2576 1568 R90
WINDOW 0 0 32 VBottom 2
WINDOW 3 32 32 VTop 2
SYMATTR InstName C77
SYMATTR Value 1a
SYMBOL cap 2928 1568 R90
WINDOW 0 0 32 VBottom 2
WINDOW 3 32 32 VTop 2
SYMATTR InstName C78
SYMATTR Value 1a
SYMBOL cap 2944 1872 R90
WINDOW 0 0 32 VBottom 2
WINDOW 3 32 32 VTop 2
SYMATTR InstName C79
SYMATTR Value 1a
SYMBOL cap 2576 1872 R90
WINDOW 0 0 32 VBottom 2
WINDOW 3 32 32 VTop 2
SYMATTR InstName C80
SYMATTR Value 1a
SYMBOL voltage 2608 1392 R0
WINDOW 123 0 0 Left 0
WINDOW 39 0 0 Left 0
SYMATTR InstName V33
SYMATTR Value 10m
SYMBOL voltage 3184 1392 R0
WINDOW 123 0 0 Left 0
WINDOW 39 0 0 Left 0
SYMATTR InstName V34
SYMATTR Value -10m
SYMBOL bv 736 1760 R0
WINDOW 3 43 67 Left 1
SYMATTR Value V=V(V43)+V(V45)+V(V47)
SYMATTR InstName B14
SYMBOL bv 1088 1600 R0
WINDOW 3 24 96 Left 1
SYMATTR Value V=V(V43)+V(V45)+V(V47)
SYMATTR InstName B15
SYMBOL bv 1088 1744 R0
WINDOW 3 52 83 Left 1
SYMATTR Value V=V(V43)+V(V45)+V(V47)
SYMATTR InstName B16
SYMBOL bv 736 2944 R0
WINDOW 3 50 72 Left 1
SYMATTR Value V=V(V61)+V(V63)+V(V65)
SYMATTR InstName B34
SYMBOL bv 1088 2784 R0
WINDOW 3 24 96 Left 1
SYMATTR Value V=V(V61)+V(V63)+V(V65)
SYMATTR InstName B35
SYMBOL bv 1088 2928 R0
WINDOW 3 24 96 Left 1
SYMATTR Value V=V(V61)+V(V63)+V(V65)
SYMATTR InstName B36
SYMBOL bv 1648 1760 R0
WINDOW 3 43 69 Left 1
SYMATTR Value V=V(V50)+V(V51)+V(V53)
SYMATTR InstName B30
SYMBOL bv 2080 1600 R0
WINDOW 3 24 96 Left 1
SYMATTR Value V=V(V50)+V(V51)+V(V53)
SYMATTR InstName B31
SYMBOL bv 2080 1744 R0
WINDOW 3 24 96 Left 1
SYMATTR Value V=V(V50)+V(V51)+V(V53)
SYMATTR InstName B32
SYMBOL bv 3072 1600 R0
WINDOW 3 24 96 Left 1
SYMATTR Value V=V(V57)+V(V59)-V(V55)
SYMATTR InstName B38
SYMBOL bv 2720 1760 R0
WINDOW 3 59 65 Left 1
SYMATTR Value V=V(V57)+V(V59)-V(V55)
SYMATTR InstName B39
SYMBOL bv 3072 1744 R0
WINDOW 3 24 96 Left 1
SYMATTR Value V=V(V57)+V(V59)-V(V55)
SYMATTR InstName B40
TEXT -928 1320 Left 2 !.tran 160n
TEXT -984 -112 Left 5 ;A
TEXT -480 352 Left 5 ;B
TEXT 2192 312 Left 5 ;C
TEXT 3400 -248 Left 5 ;SUM
TEXT 3312 1520 Left 5 ;CARRY

The netlist it stands for:
* full_adder.asc
B1 N003 0 V=(V(V4)-V(V2)+V(V3))
B2 V15 0 V=(V(V4)-V(V2)+V(V3))
B3 0 N006 V=(V(V4)-V(V2)+V(V3))
B4 0 V16 V=(V(V4)-V(V2)+V(V3))
C1 V1 N003 1a
C2 V4 V15 1a
C3 V16 V6 1a
C4 N006 V3 1a
C5 N003 V65 1a
C6 V15 N003 1a
C7 V16 N006 1a
C8 N006 V66 1a
V1 V65 0 PULSE(-10m 10m 0 0.001n 0.001n 20n 40n)
V2 V66 0 PULSE(10m -10m 20n 0.001n 0.001n 20n 40n)
V3 V3 0 PULSE(-10m 10m 0 0.001n 0.001n 40n 80n)
V4 V6 0 PULSE(10m -10m 40n 0.001n 0.001n 40n 80n)
V6 V1 0 10m
V5 V4 0 -10m
B5 N007 0 V=(V(V8)+V(V9)-V(V11))
B6 V17 0 V=(V(V8)+V(V9)-V(V11))
B7 0 N008 V=(V(V8)+V(V9)-V(V11))
B8 0 V18 V=(V(V8)+V(V9)-V(V11))
C9 V7 N007 1a
C10 V8 V17 1a
C11 V18 V64 1a
C12 N008 V63 1a
C13 N007 V9 1a
C14 V17 N007 1a
C15 V18 N008 1a
C16 N008 V10 1a
V7 V9 0 PULSE(-10m 10m 0 0.001n 0.001n 20n 40n)
V8 V10 0 PULSE(10m -10m 20n 0.001n 0.001n 20n 40n)
V9 V63 0 PULSE(-10m 10m 0 0.001n 0.001n 40n 80n)
V10 V64 0 PULSE(10m -10m 40n 0.001n 0.001n 40n 80n)
V11 V7 0 10m
V12 V8 0 -10m
B9 N001 0 V=-(V(V15)*V(V17))/V(V14)
B10 V27 0 V=-(V(V15)*V(V17))/V(V14)
B11 0 N004 V=-(V(V15)*V(V17))/V(V14)
B12 0 V28 V=-(V(V15)*V(V17))/V(V14)
C17 V13 N001 1a
C18 V14 V27 1a
C19 V28 V18 1a
C20 N004 V17 1a
C21 N001 V15 1a
C22 V27 N001 1a
C23 V28 N004 1a
C24 N004 V16 1a
V17 V13 0 -10m
V18 V14 0 10m
B13 N009 0 V=V(V43)+V(V45)+V(V47)
C25 V44 N009 1a
C26 V43 V51 1a
C27 V52 V64 1a
C28 N012 V63 1a
C29 N009 V65 1a
C30 V51 N009 1a
C31 V52 N012 1a
C32 N012 V66 1a
V13 V44 0 10m
V14 V43 0 10m
B17 N002 0 V=V(V27)*(V(V29)/V(V25))
B18 SUM1 0 V=V(V27)*(V(V29)/V(V25))
B19 0 N005 V=V(V27)*(V(V29)/V(V25))
B20 0 SUM2 V=V(V27)*(V(V29)/V(V25))
C33 V26 N002 1a
C34 V25 SUM1 1a
C35 SUM2 V30 1a
C36 N005 V29 1a
C37 N002 V27 1a
C38 SUM1 N002 1a
C39 SUM2 N005 1a
C40 N005 V28 1a
V19 V29 0 PULSE(-10m 10m 0 0.001n 0.001n 80n 160n)
V20 V30 0 PULSE(10m -10m 80n 0.001n 0.001n 80n 160n)
V21 V26 0 10m
V22 V25 0 -10m
B29 N010 0 V=V(V50)+V(V51)+V(V53)
C57 V49 N010 1a
C58 V50 V57 1a
C59 V58 V54 1a
C60 N013 V53 1a
C61 N010 V51 1a
C62 V57 N010 1a
C63 V58 N013 1a
C64 N013 V52 1a
V15 V49 0 10m
V16 V50 0 -10m
V23 V53 0 PULSE(-10m 10m 0 0.001n 0.001n 80n 160n)
V24 V54 0 PULSE(10m -10m 80n 0.001n 0.001n 80n 160n)
B33 N015 0 V=V(V61)+V(V63)+V(V65)
C65 V62 N015 1a
C66 V61 V59 1a
C67 V60 V66 1a
C68 N016 V65 1a
C69 N015 V63 1a
C70 V59 N015 1a
C71 V60 N016 1a
C72 N016 V64 1a
V31 V62 0 10m
V32 V61 0 -10m
B37 N011 0 V=-V(V55)+V(V57)+V(V59)
C73 V56 N011 1a
C74 V55 carry1 1a
C75 carry2 V60 1a
C76 N014 V59 1a
C77 N011 V57 1a
C78 carry1 N011 1a
C79 carry2 N014 1a
C80 N014 V58 1a
V33 V56 0 10m
V34 V55 0 -10m
B14 0 N012 V=V(V43)+V(V45)+V(V47)
B15 V51 0 V=V(V43)+V(V45)+V(V47)
B16 0 V52 V=V(V43)+V(V45)+V(V47)
B34 0 N016 V=V(V61)+V(V63)+V(V65)
B35 V59 0 V=V(V61)+V(V63)+V(V65)
B36 0 V60 V=V(V61)+V(V63)+V(V65)
B30 0 N013 V=V(V50)+V(V51)+V(V53)
B31 V57 0 V=V(V50)+V(V51)+V(V53)
B32 0 V58 V=V(V50)+V(V51)+V(V53)
B38 carry1 0 V=V(V57)+V(V59)-V(V55)
B39 0 N014 V=V(V57)+V(V59)-V(V55)
B40 0 carry2 V=V(V57)+V(V59)-V(V55)
.tran 160n
* A
* B
* C
* SUM
* CARRY
.backanno
.end